# EasyEDA Pro project esp32s3clock.epro, schematic Schematic2

## Sheets
1 P1: Assembly Variant: Basic; Board Name: Board2; Create Date: 2026-11-11; Page Name: P1; Project Name: ESPRESSIF32-S3_CLOCK_BAT; Schematic Name: Schematic2; Update Date: 2026-11-11; Company: https://www.lovesp32.com; Page Size: A4; Version: v4.0
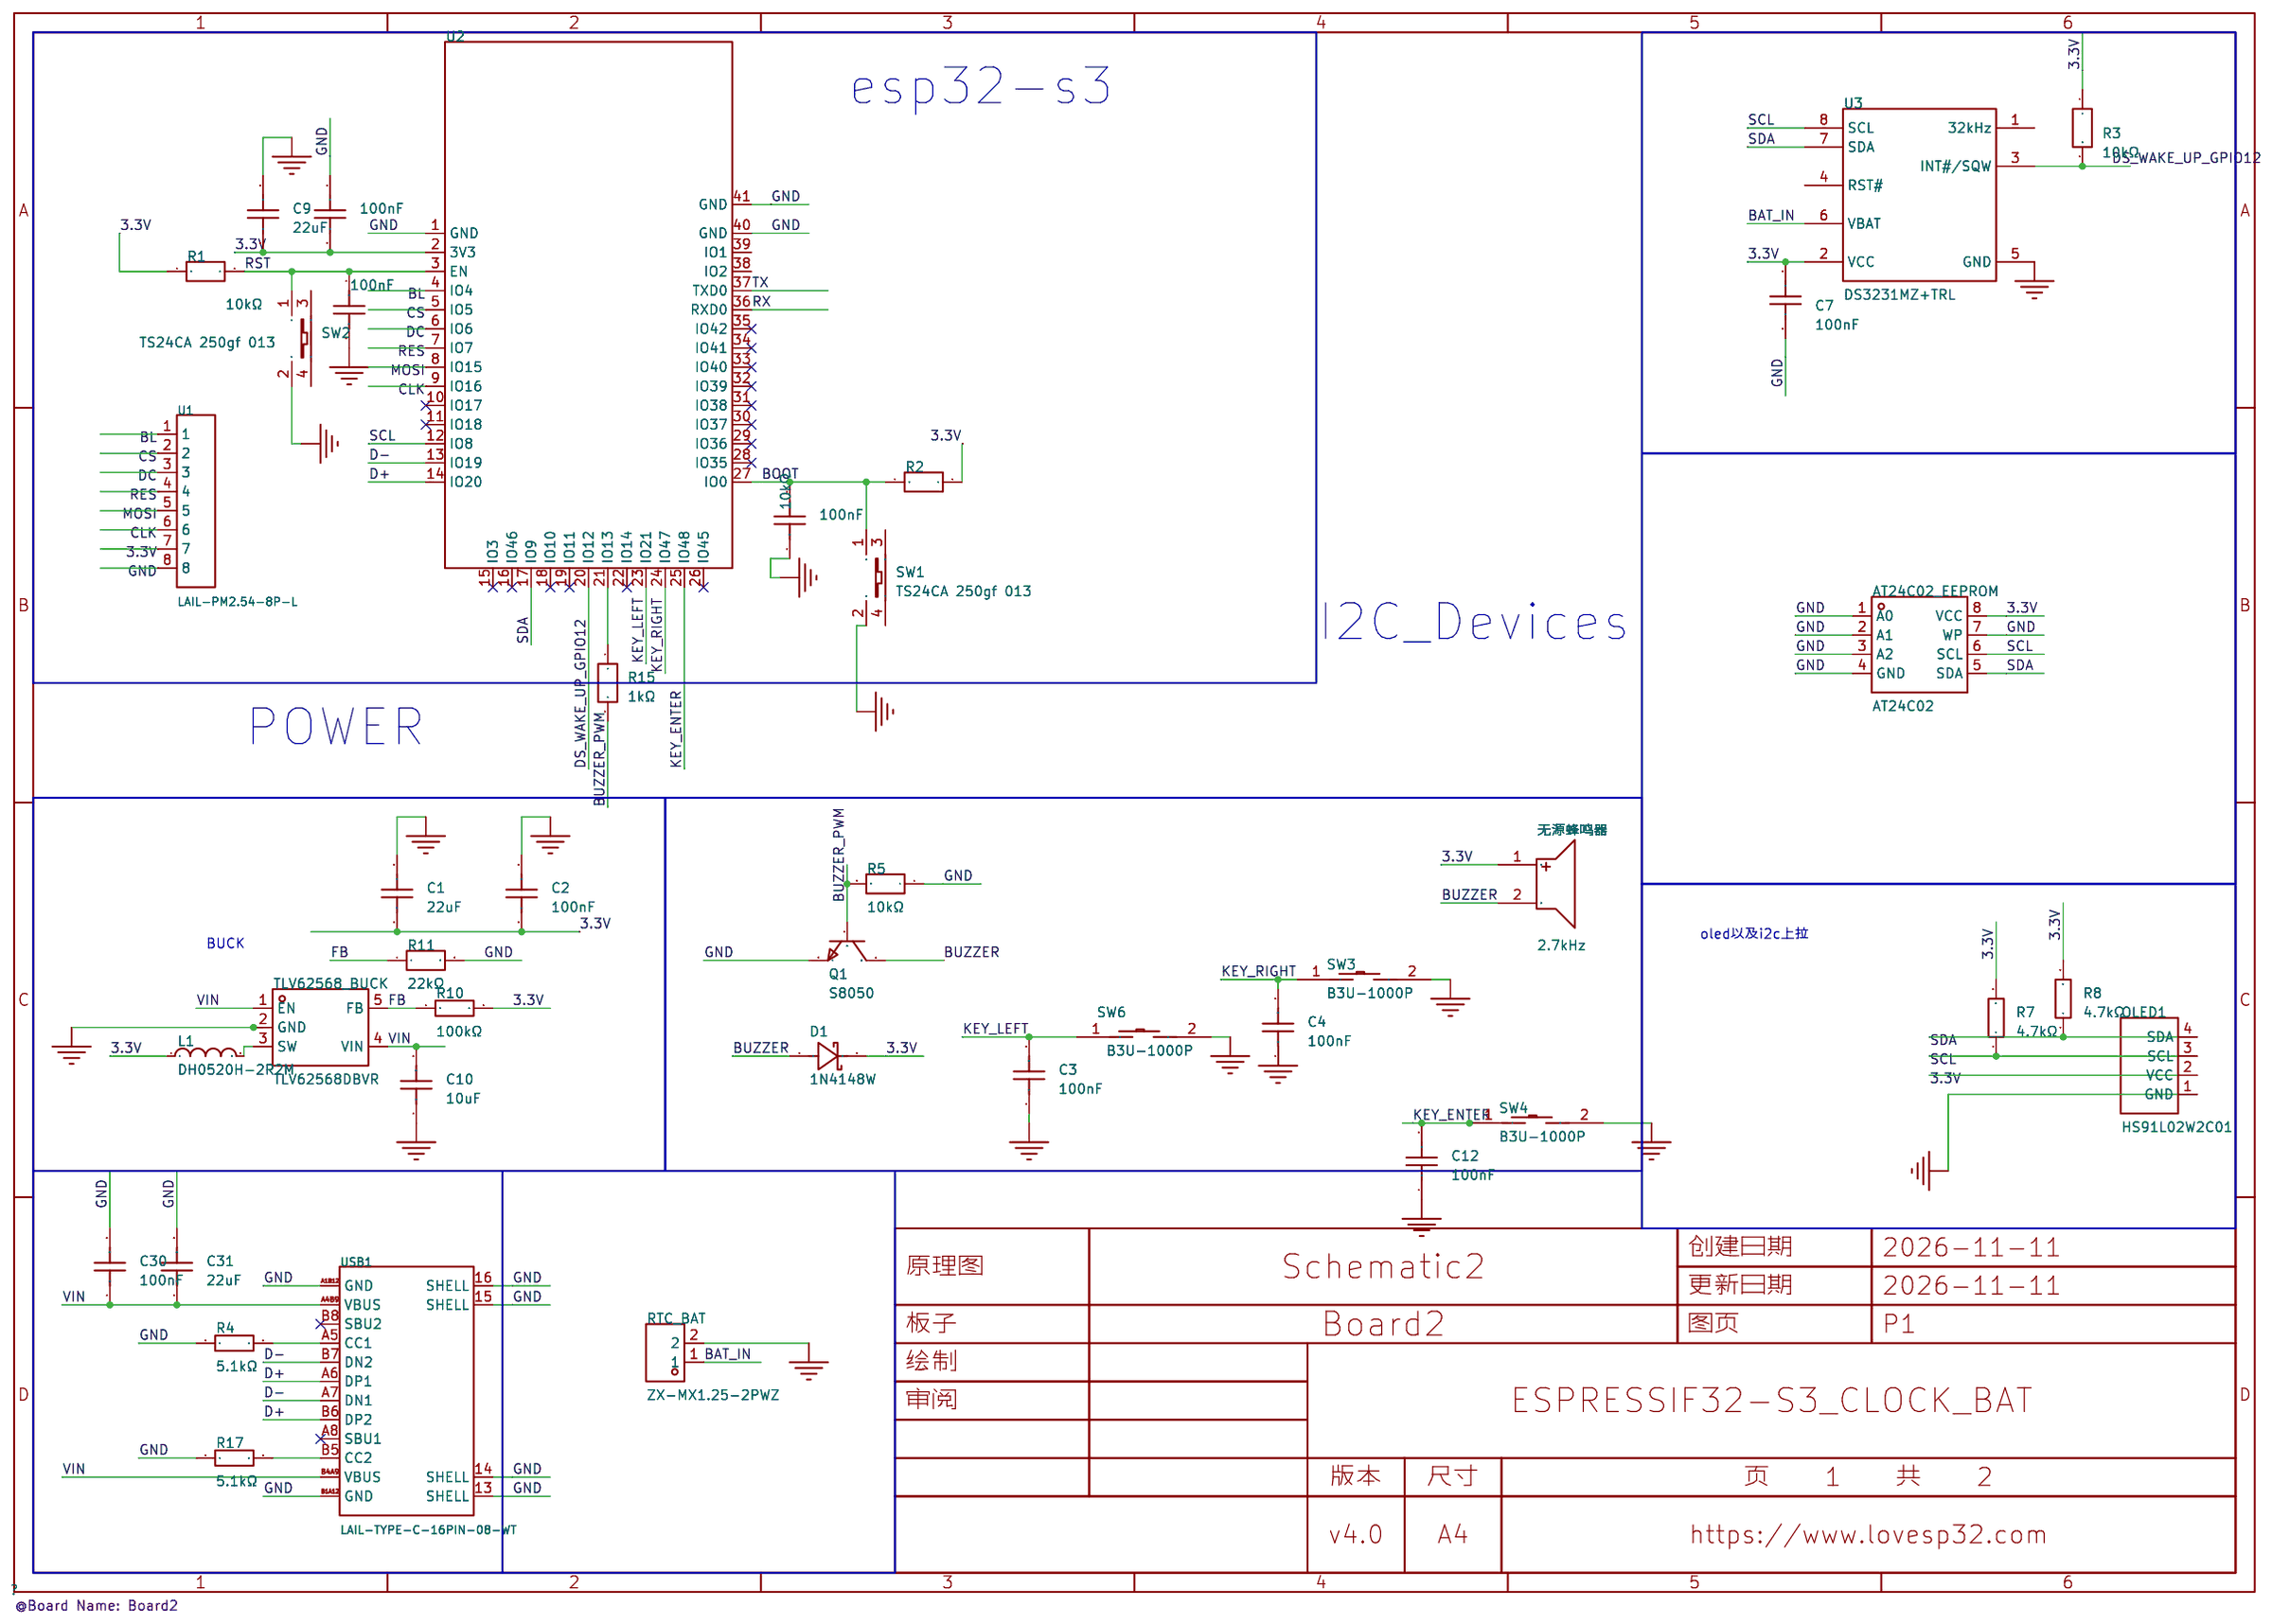
[diagram p2: P1]
2 bat: Page Name: bat; Company: 嘉立创EDA
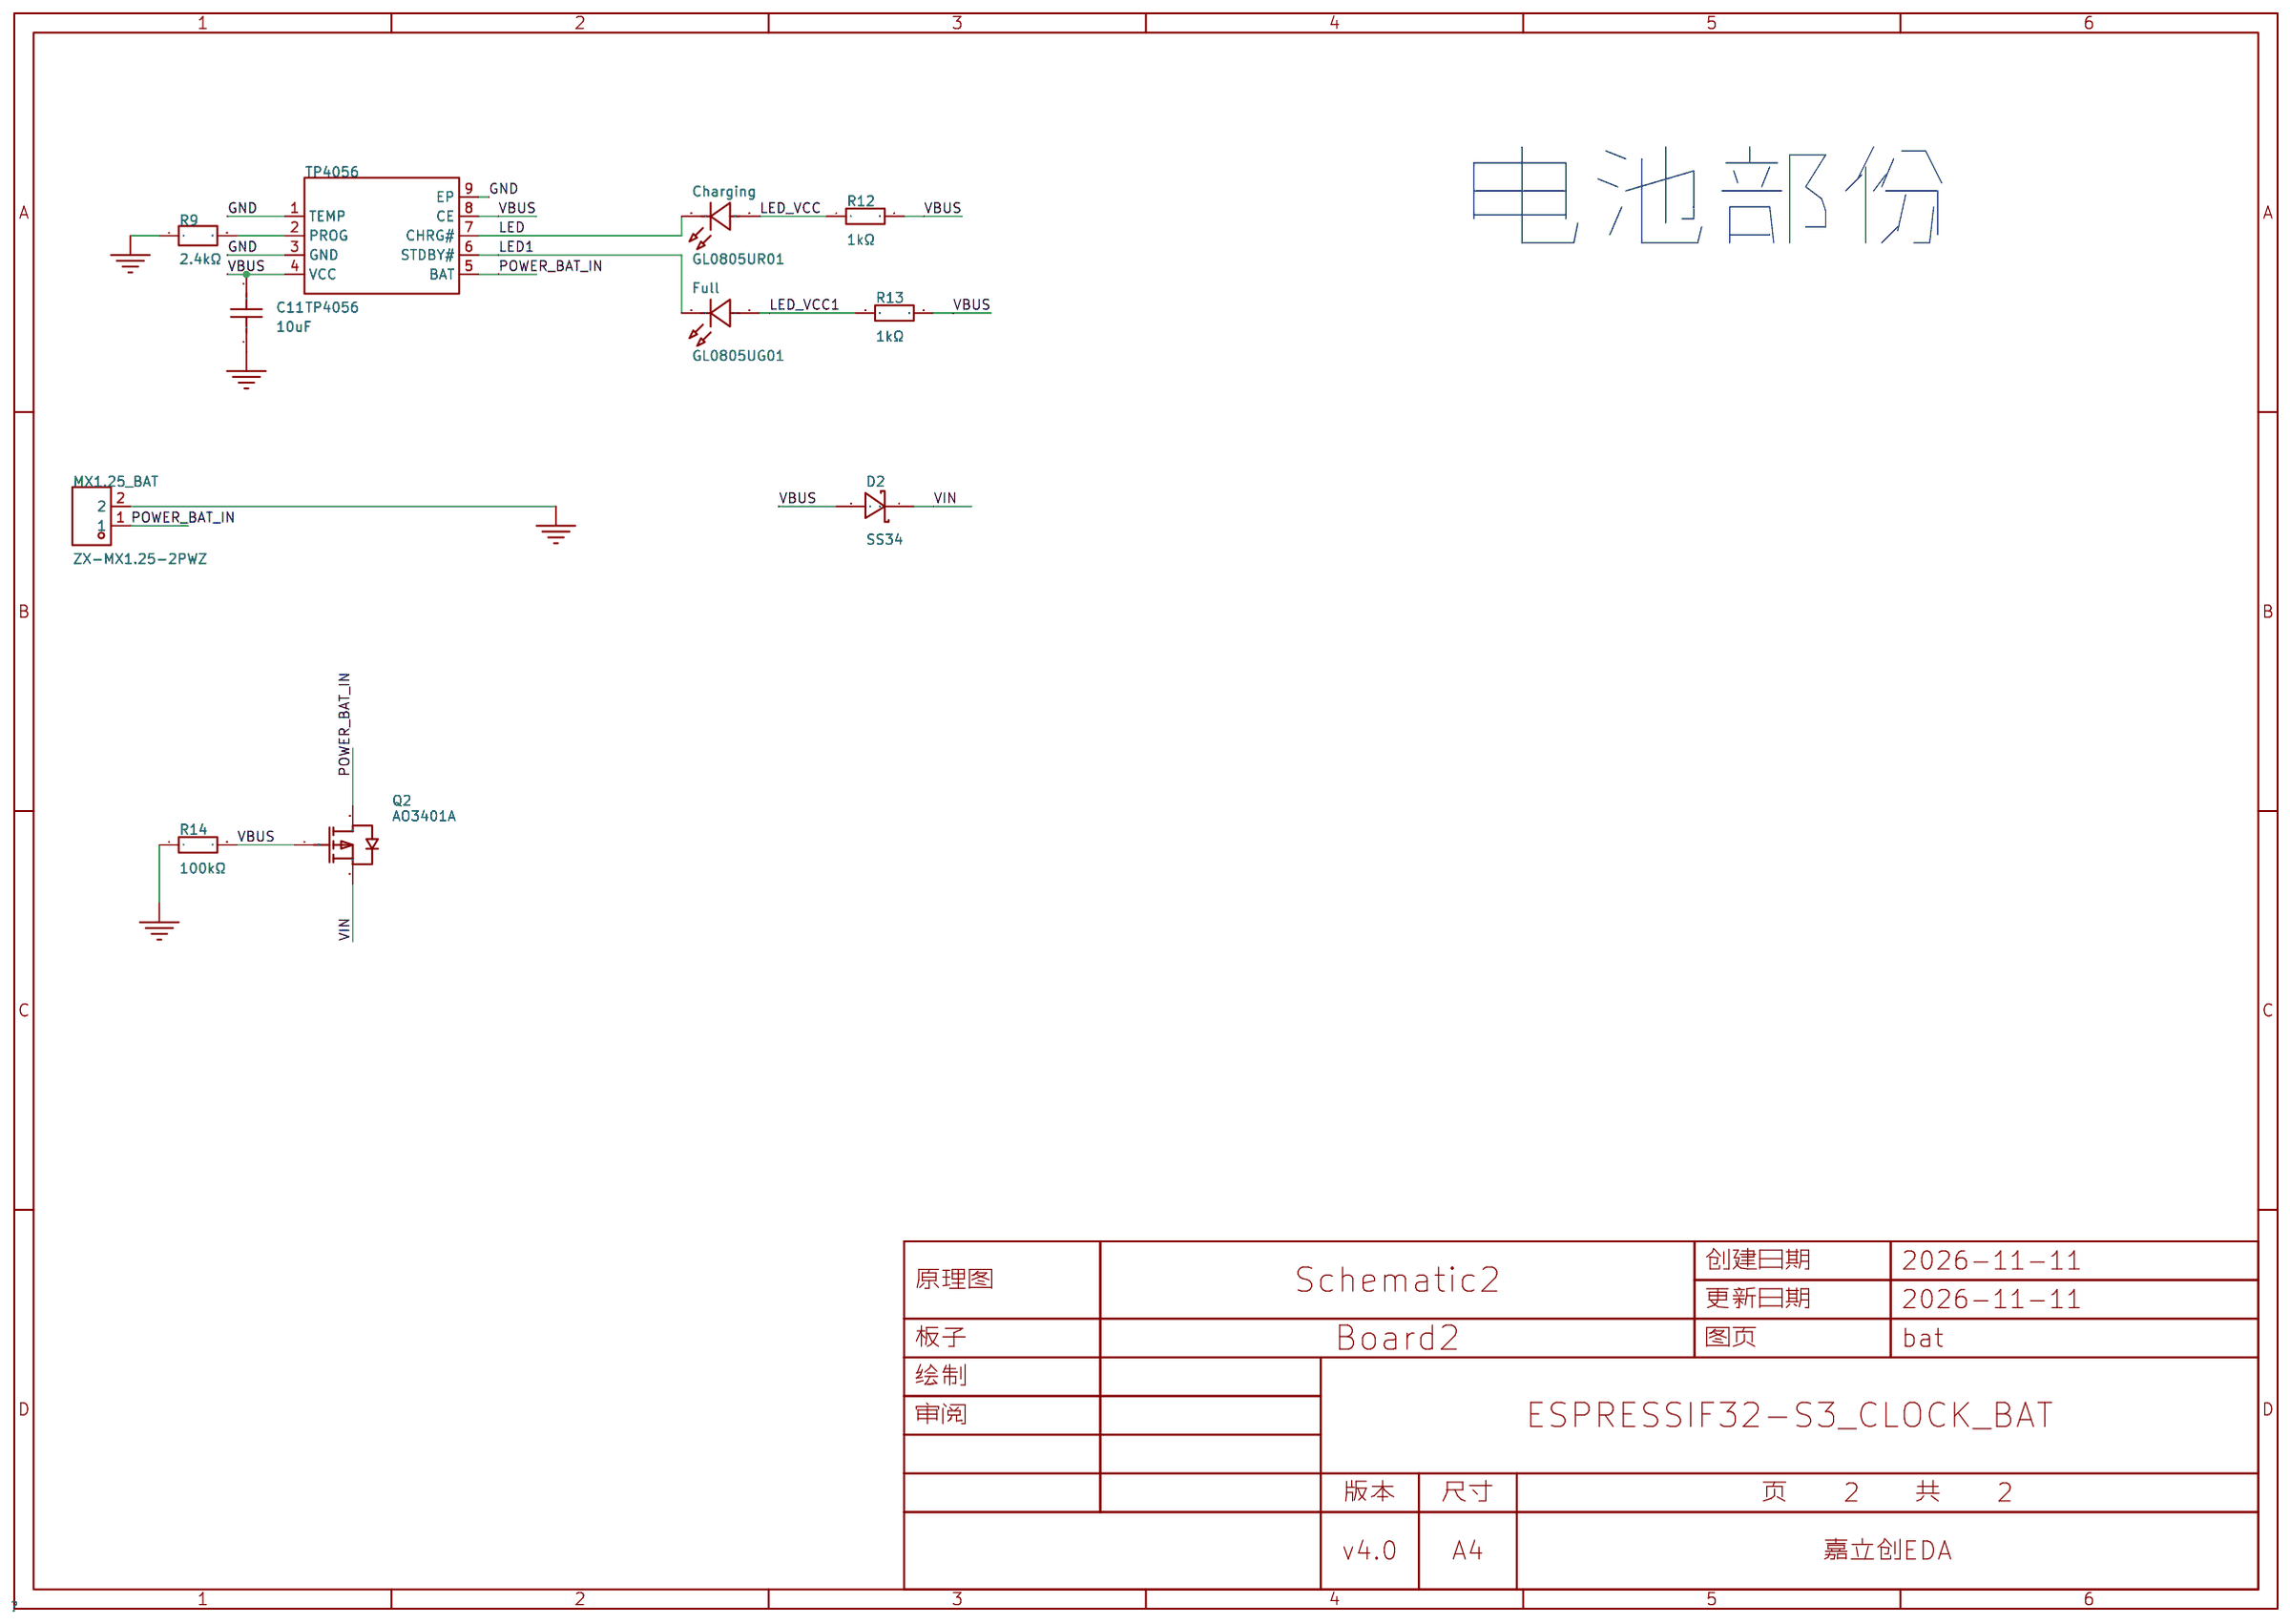
[diagram p3: bat]

## Parts
sheet bat
C11  10uF  [C0805]
Charging  GL0805UR01  [LED0805-R-RD_RED]
D2  SS34  [SMC_L6.9-W5.9-LS7.9-RD]
Full  GL0805UG01  [LED0805-FD_GL0805UG01]
MX1.25_BAT  ZX-MX1.25-2PWZ  [CONN-TH_2P-P1.25_ZX-MX1.25-2PWZ]
Q2  AO3401A  [SOT-23_L2.9-W1.3-P1.90-LS2.4-BR]
R9  2.4kΩ  [R0603]
R12  1kΩ  [R0805]
R13  1kΩ  [R0805]
R14  100kΩ  [R0805]
TP4056  TP4056  [ESOP-8_L4.9-W3.9-P1.27-LS6.0-BL-EP]
sheet P1
AT24C02_EEPROM  AT24C02  [SOP-8_L5.0-W4.0-P1.27-LS6.0-BL]
C1  22uF  [C1210]
C2  100nF  [C0805]
C3  100nF  [C0805]
C4  100nF  [C0805]
C5  100nF  [C0805]
C6  100nF  [C0805]
C7  100nF  [C0805]
C8  100nF  [C0805]
C9  22uF  [C1210]
C10  10uF  [C0805]
C12  100nF  [C0805]
C30  100nF  [C0805]
C31  22uF  [C1206]
D1  1N4148W  [SOD-123_L2.7-W1.6-LS3.7-FD]
L1  DH0520H-2R2M  [IND-SMD_L5.6-W5.2_MST0530H-150M]
OLED1  HS91L02W2C01  [OLED-TH_L38.0-W12.0_HS91L02W2C01]
Q1  S8050  [SOT-23-3_L2.9-W1.3-P1.90-LS2.3-BR]
R1  10kΩ  [R0603]
R2  10kΩ  [R0603]
R3  10kΩ  [R0603]
R4  5.1kΩ  [R0603]
R5  10kΩ  [R0603]
R7  4.7kΩ  [R0603]
R8  4.7kΩ  [R0603]
R10  100kΩ  [R0805]
R11  22kΩ  [R0805]
R15  1kΩ  [R0603]
R17  5.1kΩ  [R0603]
RTC_BAT  ZX-MX1.25-2PWZ  [CONN-TH_2P-P1.25_ZX-MX1.25-2PWZ]
SW1  TS24CA 250gf 013  [SW-SMD_L4.7-W3.5-P3.35-EH]
SW2  TS24CA 250gf 013  [SW-SMD_L4.7-W3.5-P3.35-EH]
SW3  B3U-1000P  [KEY-SMD_B3U-1000PM]
SW4  B3U-1000P  [KEY-SMD_B3U-1000PM]
SW6  B3U-1000P  [KEY-SMD_B3U-1000PM]
TLV62568_BUCK  TLV62568DBVR  [SOT-23-5_L3.0-W1.7-P0.95-LS2.8-BR]
U1  LAIL-PM2.54-8P-L  [HDR-TH_LAIL-PM2.54-8P-L]
U2  2.4GHz  [WIRELM-SMD_ESP32-S3-WROOM-1]
U3  DS3231MZ+TRL  [SOIC-8_L4.9-W3.9-P1.27-LS6.0-BL]
USB1  LAIL-TYPE-C-16PIN-08-WT  [TYPE-C-SMD_LAIL-TYPE-C-16PIN-08-WT]
无源蜂鸣器  2.7kHz  [BUZ-TH_BD9.0-P4.00-D0.6-FD]

## Library data of the parts
C10 C11 = CL21A106KAYNNNE_C15850: 容值:10uF;精度:±10%;额定电压:25V;温度系数:X5R;; LCSC Part Name: 10uF ±10% 25V; Supplier Part: C15850; Manufacturer: SAMSUNG(三星); Manufacturer Part: CL21A106KAYNNNE; Supplier Footprint: 0805; JLCPCB Part Class: Basic Part; Datasheet: https://item.szlcsc.com/datasheet/CL21A106KAYNNNE/16532.html; Supplier: LCSC; Tolerance: ±10%; Voltage Rating: 25V; Temperature Coefficient: X5R
Charging = GL0805UR01: 灯头类型:2mmx1.25mm方形灯头;发光颜色:红色;正向压降(Vf):1.8V~2.1V;功率:-;测试电流:20mA;波长:620nm~625nm;二极管配置:独立二极管;透镜颜色:无色透明透镜;色温:-;发光强度:80mcd~100mcd;发光角度:120°;载带方式:正贴;工作温度:-40℃~+85℃;; LCSC Part Name: 0805 红灯 高亮; Supplier Part: C51933307; Manufacturer: Guiguang light(桂光光电); Supplier Footprint: 0805; JLCPCB Part Class: Extended Part; Datasheet: https://item.szlcsc.com/datasheet/GL0805UR01/54646003.html; Supplier: LCSC; Lamp Holder Type: 2mmx1.25mm方形灯头; Illumination Color: 红色; Voltage - Forward(Vf): 1.8V~2.1V; Test Current: 20mA; Wavelength - Dominant: 620nm~625nm; Diode Configuration: 独立二极管; Lens Color: 无色透明透镜; Luminous Intensity: 80mcd~100mcd; Viewing Angle: 120°; Mounting Style: 正贴; Operating Temperature: -40℃~+85℃
D2 = SS34_C154551: 正向压降(Vf):500mV@3A;直流反向耐压(Vr):40V;整流电流:3A;; LCSC Part Name: 电压:40V 电流:3A; Supplier Part: C154551; Manufacturer: onsemi(安森美); Supplier Footprint: SMC(DO-214AB); JLCPCB Part Class: Extended Part; Datasheet: https://item.szlcsc.com/datasheet/SS34/165893.html; Supplier: LCSC; Voltage - Forward(Vf@If): 500mV@3A; Voltage - DC Reverse(Vr): 40V; Current - Rectified: 3A; Reverse Leakage Current (Ir): 500uA@40V; Operating Junction Temperature Range: -55℃~+150℃; Non-Repetitive Peak Forward Surge Current: 100A
Full = GL0805UG01: 灯头类型:2mmx1.25mm方形灯头;发光颜色:翠绿色;正向压降(Vf):2.5V~3V;功率:-;测试电流:5mA;波长:510nm~531nm;二极管配置:独立二极管;透镜颜色:无色透明透镜;色温:-;发光强度:144mcd~300mcd;发光角度:120°;载带方式:正贴;工作温度:-40℃~+85℃;; LCSC Part Name: 0805 翠绿 高亮; Supplier Part: C51933308; Manufacturer: Guiguang light(桂光光电); Supplier Footprint: 0805; JLCPCB Part Class: Extended Part; Datasheet: https://item.szlcsc.com/datasheet/GL0805UG01/54646004.html; Supplier: LCSC; Lamp Holder Type: 2mmx1.25mm方形灯头; Illumination Color: 翠绿色; Voltage - Forward(Vf): 2.5V~3V; Test Current: 5mA; Wavelength - Dominant: 510nm~531nm; Diode Configuration: 独立二极管; Lens Color: 无色透明透镜; Luminous Intensity: 144mcd~300mcd; Viewing Angle: 120°; Mounting Style: 正贴; Operating Temperature: -40℃~+85℃
MX1.25_BAT RTC_BAT = ZX-MX1.25-2PWZ: 插针结构:1x2P;间距:1.25mm;安装方式:弯插;参考系列:PicoBlade(MX 1.25);总PIN数:2P;排数:1;每排PIN数:2;行距:-;额定电流:1A;触头材质:黄铜;触头镀层:锡;工作温度:-25℃~+85℃;; LCSC Part Name: 1x2P 间距:1.25mm 弯插 系列:PicoBlade(MX 1.25); Supplier Part: C7430463; Manufacturer: Megastar(兆星); Supplier Footprint: 弯插,P=1.25mm; JLCPCB Part Class: Extended Part; Datasheet: https://item.szlcsc.com/datasheet/ZX-MX1.25-2PWZ/8430332.html; Supplier: LCSC; Pins Structure: 1x2P; Pitch: 1.25mm; Mounting Type: 弯插; Reference Series: PicoBlade(MX 1.25); Number of Pins: 2P; Number of Rows: 1; Number of PINs Per Row: 2; Current Rating: 1A; Contact Material: 黄铜; Contact Plating: 锡; Operating Temperature: -25℃~+85℃; Voltage Rating: 125V; Plastic Material: LCP; Flame Retardant Rating: UL94V-0; Color: 米色; Z-Height of the Board: 3.3mm; X-Length of Bottom Edge on Board (Spacing Line): 4.4mm; Y-Width of Bottom Edge on Board: 4.6mm
Q2 = AO3401A_C15127: 数量:1个P沟道;漏源电压(Vdss):30V;连续漏极电流(Id):4A;导通电阻(RDS(on)):47mΩ@10V；85mΩ@2.5V；60mΩ@4.5V;耗散功率(Pd):-;阈值电压(Vgs(th)):900mV;; LCSC Part Name: 1个P沟道 耐压:30V 电流:4A; Supplier Part: C15127; Manufacturer: AOS; Supplier Footprint: SOT-23; JLCPCB Part Class: Basic Part; Datasheet: https://item.szlcsc.com/datasheet/AO3401A/15801.html; Supplier: LCSC; Number: 1个P沟道; Drain to Source Voltage: 30V; Current - Continuous Drain(Id): 4A; RDS(on): 47mΩ@10V；85mΩ@2.5V；60mΩ@4.5V; Gate Threshold Voltage (Vgs(th)): 900mV; Gate Charge(Qg): 14nC@10V; Input Capacitance(Ciss): 645pF; Reverse Transfer Capacitance (Crss@Vds): 55pF; Output Capacitance(Coss): 80pF
R9 = FRC0603F2401TS: 电阻类型:厚膜电阻;阻值:2.4kΩ;精度:±1%;功率:100mW;工作电压:75V;温度系数:±100ppm/℃;; LCSC Part Name: 2.4kΩ ±1% 100mW 厚膜电阻; Supplier Part: C2907007; Manufacturer: FOJAN(富捷); Supplier Footprint: 0603; JLCPCB Part Class: Extended Part; Supplier: LCSC; Type: 厚膜电阻; Tolerance: ±1%; Power(Watts): 100mW; Voltage-Supply(Max): 75V; Temperature Coefficient: ±100ppm/℃; Operating Temperature: -55℃~+155℃
R12 R13 = 0805W8F1001T5E: 电阻类型:厚膜电阻;阻值:1kΩ;精度:±1%;功率:125mW;最大工作电压:150V;温度系数:±100ppm/℃;; LCSC Part Name: 1kΩ ±1% 125mW 厚膜电阻; Supplier Part: C17513; Manufacturer: UNI-ROYAL(厚声); Supplier Footprint: 0805; JLCPCB Part Class: Basic Part; Datasheet: https://atta.szlcsc.com/upload/public/pdf/source/20200306/C422600_1E6D84923E4A46A82E41ADD87F860B5C.pdf; Supplier: LCSC; Type: 厚膜电阻; Tolerance: ±1%; Power(Watts): 125mW; Overload Voltage (Max): 150V; Temperature Coefficient: ±100ppm/℃; Operating Temperature Range: -55℃~+155℃
R10 R14 = 0805W8F1003T5E: 电阻类型:厚膜电阻;阻值:100kΩ;精度:±1%;功率:125mW;工作电压:150V;温度系数:±100ppm/℃;; LCSC Part Name: 100kΩ ±1% 125mW 厚膜电阻; Supplier Part: C149504; Manufacturer: UNI-ROYAL(厚声); Supplier Footprint: 0805; JLCPCB Part Class: Basic Part; Datasheet: https://item.szlcsc.com/datasheet/0805W8F1003T5E/160838.html; Supplier: LCSC; Type: 厚膜电阻; Tolerance: ±1%; Power(Watts): 125mW; Voltage-Supply(Max): 150V; Temperature Coefficient: ±100ppm/℃; Operating Temperature: -55℃~+155℃
TP4056 = TP4056_C725790: 工作电压:4V~6.5V;最大充电电流:1A;电池类型:锂电池;电池节数:1;; LCSC Part Name: 1A独立式线性锂离子电池充电器; Supplier Part: C725790; Manufacturer: UMW(友台半导体); Supplier Footprint: ESOP-8; JLCPCB Part Class: Extended Part; Datasheet: https://item.szlcsc.com/datasheet/TP4056/772193.html; Supplier: LCSC; The Chip Type: 充电芯片; Voltage - Supply: 4V~6.5V; Charge Current - Max: 1A; Charging Saturation Voltage: 4.2V; Type of Battery: 锂电池; Number of Cells: 1; Operating Temperature: -40℃~+85℃; Battery Temperature Detection: 支持; 0V Battery Charge: 支持; Supply Current (Iq): 35uA; Features: 恒压充电；恒流充电；自动再充电；充电终止；软启动；可编程充电电流；欠压锁定；涓流充电
AT24C02_EEPROM = AT24C02_C688857: 接口类型:I2C;存储容量:2Kbit;时钟频率(fc):1MHz;; LCSC Part Name: 24C02 2Kbit电可擦除PROM; Supplier Part: C688857; Manufacturer: IDCHIP(英锐芯); Supplier Footprint: SOP-8; JLCPCB Part Class: Extended Part; Datasheet: https://item.szlcsc.com/datasheet/AT24C02/721923.html; Supplier: LCSC; Interface: I2C; Memory Size: 2Kbit; Clock Frequency: 1MHz; Write Cycle Time(Tw): 5ms; Data Retention - TDR (Year): 100年; Write Cycle Endurance: 100万次; Features: 硬件写保护功能；噪声抑制功能; Voltage - Supply: 1.8V~5.5V; Operating Temperature: -40℃~+85℃; Operating Current: 1mA; Standby Current: 1uA; Access Time: 900ns
C1 C9 = CL32A226KAJNNNE: 容值:22uF;精度:±10%;额定电压:25V;温度系数:X5R;; LCSC Part Name: 22uF ±10% 25V; Supplier Part: C52306; Manufacturer: SAMSUNG(三星); Supplier Footprint: 1210; JLCPCB Part Class: Extended Part; Datasheet: https://item.szlcsc.com/datasheet/CL32A226KAJNNNE/53320.html; Supplier: LCSC; Tolerance: ±10%; Voltage Rating: 25V; Temperature Coefficient: X5R
C2-C4 C7 C12 = CL21B104KBCNNNC: 容值:100nF;精度:±10%;额定电压:50V;温度系数:X7R;; LCSC Part Name: 100nF ±10% 50V; Supplier Part: C1711; Manufacturer: SAMSUNG(三星); Supplier Footprint: 0805; JLCPCB Part Class: Extended Part; Datasheet: https://item.szlcsc.com/datasheet/CL21B104KBCNNNC/2063.html; Supplier: LCSC; Tolerance: ±10%; Voltage Rating: 50V; Temperature Coefficient: X7R
C5 C6 C8 = CC0805KRX7R9BB104: 容值:100nF;精度:±10%;额定电压:50V;温度系数:X7R;; LCSC Part Name: 100nF ±10% 50V; Supplier Part: C49678; Manufacturer: YAGEO(国巨); Supplier Footprint: 0805; JLCPCB Part Class: Basic Part; Datasheet: https://item.szlcsc.com/datasheet/CC0805KRX7R9BB104/50686.html; Supplier: LCSC; Tolerance: ±10%; Voltage Rating: 50V; Temperature Coefficient: X7R
C30 = FCC0805B104K500DT: 容值:100nF;精度:±10%;额定电压:50V;温度系数:X7R;; LCSC Part Name: 100nF ±10% 50V; Supplier Part: C5137467; Manufacturer: FOJAN(富捷); Supplier Footprint: 0805; JLCPCB Part Class: Extended Part; Datasheet: https://item.szlcsc.com/datasheet/FCC0805B104K500DT/5746969.html; Supplier: LCSC; Tolerance: ±10%; Voltage Rating: 50V; Temperature Coefficient: X7R; Operating Temperature: -55℃~+125℃
C31 = HGC1206R5226M250NSPJ: 容值:22uF;精度:±20%;额定电压:25V;温度系数:X5R;; LCSC Part Name: 22uF ±20% 25V; Supplier Part: C7432786; Manufacturer: Chinocera(华瓷); Supplier Footprint: 1206; JLCPCB Part Class: Extended Part; Datasheet: https://item.szlcsc.com/datasheet/HGC1206R5226M250NSPJ/8438268.html; Supplier: LCSC; Tolerance: ±20%; Voltage Rating: 25V; Temperature Coefficient: X5R
D1 = 1N4148W_C7420318: 二极管配置:独立式;整流电流:150mA;直流反向耐压(Vr):100V;正向压降(Vf):1.25V@150mA;反向恢复时间(Trr):4ns;; LCSC Part Name: 100V 150mA; Supplier Part: C7420318; Manufacturer: R+O(宏嘉诚); Supplier Footprint: SOD-123; JLCPCB Part Class: Extended Part; Datasheet: https://item.szlcsc.com/datasheet/1N4148W/8397140.html; Supplier: LCSC; Diode Configuration: 独立式; Pd - Power Dissipation: 400mW; Current - Rectified: 150mA; Voltage - DC Reverse(Vr): 100V; Voltage - Forward(Vf@If): 1.25V@150mA; Non-Repetitive Peak Forward Surge Current: 2A; Reverse Leakage Current (Ir): 1uA@75V; Reverse Recovery Time (trr): 4ns; Operating Junction Temperature Range: -55℃~+150℃
L1 = DH0520H-2R2M: 一体成型电感，功率电感，合金电感，贴片电感.公司通过ISO90001:2015和IATF16949:2016体系认证，产品主要应用于：汽车电子(车灯、车机屏、BMS、自动驾驶控制模块等)、电脑主板(台式、笔记本、平板)、显卡、交换机、路由器、电视机、显示器、音箱、手机、通讯基站、各种机器设备控制板等。; LCSC Part Name: DH0520H-2R2M（2.2uH); Supplier Part: C41407019; Manufacturer: DH(德鸿感应); Supplier Footprint: SMD,5.6x5.2mm; Datasheet: https://item.szlcsc.com/datasheet/DH0520H-2R2M/43206035.html; Supplier: LCSC
OLED1 = HS91L02W2C01: 主控芯片:SSD1306芯片;接口类型:I2C;尺寸(inch):0.91;像素分辨率:128x32;; LCSC Part Name: 0.91寸OLED显示屏白光IIC; Supplier Part: C5248081; Manufacturer: HS(汉昇); JLCPCB Part Class: Extended Part; Datasheet: https://item.szlcsc.com/datasheet/HS91L02W2C01/5960632.html; Supplier: LCSC; Controller Type: SSD1306芯片; Interface: I2C; Size: 0.91; Dot Pixels: 128x32; Type of Drive: 无源(PMOLED); Display Range: 22.384x5.584mm; Display Color: 白色; Luminance: 150cd/m2; Voltage - Supply  For Logic: 1.65V~3.3V
Q1 = S8050_C20069125: 晶体管类型:NPN;集电极电流(Ic):500mA;集射极击穿电压(Vceo):25V;耗散功率(Pd):300mW;直流电流增益(hFE):120;; LCSC Part Name: hFE:200-350，丝印:J3Y NPN 500mA 25V; Supplier Part: C20069125; Manufacturer: R+O(宏嘉诚); Supplier Footprint: SOT-23; JLCPCB Part Class: Extended Part; Datasheet: https://item.szlcsc.com/datasheet/S8050/21397163.html; Supplier: LCSC; type: NPN; Current - Collector(Ic): 500mA; Collector - Emitter Voltage VCEO: 25V; Pd - Power Dissipation: 300mW; DC Current Gain: 120; Transition frequency(fT): 100MHz; Current - Collector Cutoff: 100nA; Vce Saturation(VCE(sat)): 600mV; Operating Temperature: -55℃~+150℃; Emitter-Base Voltage(Vebo): 5V; Number: 1个NPN; Configuration: 独立式
R1-R3 R5 = FRC0603F1002TS: 电阻类型:厚膜电阻;阻值:10kΩ;精度:±1%;功率:100mW;工作电压:75V;温度系数:±100ppm/℃;; LCSC Part Name: 10kΩ ±1% 100mW 厚膜电阻; Supplier Part: C2906982; Manufacturer: FOJAN(富捷); Supplier Footprint: 0603; JLCPCB Part Class: Extended Part; Datasheet: https://item.szlcsc.com/datasheet/FRC0603F1002TS/3180495.html; Supplier: LCSC; Type: 厚膜电阻; Tolerance: ±1%; Power(Watts): 100mW; Voltage-Supply(Max): 75V; Temperature Coefficient: ±100ppm/℃; Operating Temperature: -55℃~+155℃
R4 R17 = 0603WAF5101T5E: 电阻类型:厚膜电阻;阻值:5.1kΩ;精度:±1%;功率:100mW;工作电压:75V;温度系数:±100ppm/℃;; LCSC Part Name: 厚膜电阻 5.1kΩ ±1%; Supplier Part: C23186; Manufacturer: UNI-ROYAL(厚声); Supplier Footprint: 0603; JLCPCB Part Class: Basic Part; Datasheet: https://item.szlcsc.com/datasheet/0603WAF5101T5E/23913.html; Supplier: LCSC; Type: 厚膜电阻; Tolerance: ±1%; Power(Watts): 100mW; Voltage-Supply(Max): 75V; Temperature Coefficient: ±100ppm/℃; Operating Temperature: -55℃~+155℃
R7 R8 = 0603WAF4701T5E: 电阻类型:厚膜电阻;阻值:4.7kΩ;精度:±1%;功率:100mW;工作电压:75V;温度系数:±100ppm/℃;; LCSC Part Name: 厚膜电阻 4.7kΩ ±1%; Supplier Part: C23162; Manufacturer: UNI-ROYAL(厚声); Supplier Footprint: 0603; JLCPCB Part Class: Basic Part; Datasheet: https://item.szlcsc.com/datasheet/0603WAF4701T5E/23889.html; Supplier: LCSC; Type: 厚膜电阻; Tolerance: ±1%; Power(Watts): 100mW; Voltage-Supply(Max): 75V; Temperature Coefficient: ±100ppm/℃; Operating Temperature: -55℃~+155℃
R11 = FRC0805F2202TS: 电阻类型:厚膜电阻;阻值:22kΩ;精度:±1%;功率:125mW;工作电压:150V;温度系数:±100ppm/℃;; LCSC Part Name: 22kΩ ±1% 125mW 厚膜电阻; Supplier Part: C2907243; Manufacturer: FOJAN(富捷); Supplier Footprint: 0805; JLCPCB Part Class: Extended Part; Datasheet: https://item.szlcsc.com/datasheet/FRC0805F2202TS/3180756.html; Supplier: LCSC; Type: 厚膜电阻; Tolerance: ±1%; Power(Watts): 125mW; Voltage-Supply(Max): 150V; Temperature Coefficient: ±100ppm/℃; Operating Temperature: -55℃~+155℃
R15 = FRC0603F1001TS: 电阻类型:厚膜电阻;阻值:1kΩ;精度:±1%;功率:100mW;工作电压:75V;温度系数:±100ppm/℃;; LCSC Part Name: 1kΩ ±1% 100mW 厚膜电阻; Supplier Part: C2907002; Manufacturer: FOJAN(富捷); Supplier Footprint: 0603; JLCPCB Part Class: Extended Part; Datasheet: https://item.szlcsc.com/datasheet/FRC0603F1001TS/3180515.html; Supplier: LCSC; Type: 厚膜电阻; Tolerance: ±1%; Power(Watts): 100mW; Voltage-Supply(Max): 75V; Temperature Coefficient: ±100ppm/℃; Operating Temperature: -55℃~+155℃
SW1 SW2 = TS24CA 250gf 013: 电路结构:单刀单掷;按钮形状:矩形按钮;作用力:2.5N;安装方式:卧贴;开关长度:4.7mm;开关宽度:1.9mm;开关高度:3.5mm;带支架:不带支架;触点电流:50mA;额定电压:12V;带灯:无;工作寿命:3万次;; LCSC Part Name: 4.55*1.8*3.5mm 卧贴 轻触开关; Supplier Part: C5373430; Manufacturer: SHOU HAN(首韩); Supplier Footprint: SMD; JLCPCB Part Class: Extended Part; Datasheet: https://item.szlcsc.com/datasheet/TS24CA%2520250gf%2520013/6227347.html; Supplier: LCSC; Circuit: 单刀单掷; Actuator Style: 矩形按钮; Operating Force: 2.5N; Mounting Type: 卧贴; Length: 4.7mm; Width: 1.9mm; Switch Height: 3.5mm; with Bracket: 不带支架; Contact Current: 50mA; Voltage Rating: 12V; Actuator/Cap Color: 黑色; With Lamp: 无; Termination Style: SMD接片; Life: 3万次; Operating Temperature: -25℃~+70℃
SW3 SW4 SW6 = B3U-1000P: 电路结构:单刀单掷;按钮形状:圆形按钮;作用力:1.53N;安装方式:立贴;开关长度:3mm;开关宽度:2.5mm;开关高度:1.6mm;触点电流:50mA;额定电压:12V;带灯:-;工作寿命:-;; LCSC Part Name: 3*2.5*1.6mm 立贴 轻触开关; Supplier Part: C231329; Manufacturer: OMRON(欧姆龙); Supplier Footprint: SMD,2.5x3mm; JLCPCB Part Class: Extended Part; Datasheet: https://item.szlcsc.com/datasheet/B3U-1000P/231216.html; Supplier: LCSC; Circuit: 单刀单掷; Actuator Style: 圆形按钮; Operating Force: 1.53N; Mounting Type: 立贴; Length: 3mm; Width: 2.5mm; Switch Height: 1.6mm; Contact Current: 50mA; Voltage Rating: 12V; Termination Style: SMD接片; Operating Temperature: -25℃~+70℃
TLV62568_BUCK = TLV62568DBVR: 功能类型:降压型;工作电压:2.5V~5.5V;输出电压:600mV~5.5V;输出电流:1A;输出类型:可调;; LCSC Part Name: 降压型 1A 2.5V~5.5V; Supplier Part: C163219; Manufacturer: TI(德州仪器); Supplier Footprint: SOT-23-5; JLCPCB Part Class: Extended Part; Datasheet: https://www.ti.com/cn/lit/ds/symlink/tlv62568.pdf; Supplier: LCSC; Function: 降压型; Voltage - Supply: 2.5V~5.5V; Output Voltage: 600mV~5.5V; Output Current: 1A; Frequency - Switching: 1.5MHz; Operating Temperature: -40℃~+125℃@(TJ); Synchronous Rectifier: 是; Number of Outputs: 1; Topology: 降压式; Quiescent Current: 35uA; Switch tube (built-in/external): 内置; Output Type: 可调; Features: 轻载高效模式；过流保护；工作状态指示
U1 = LAIL-PM2.54-8P-L: 插孔结构:1x8P;间距:2.54mm;圆孔/方孔:方孔;安装方式:直插;排数:单排;总孔位数:8P;额定电流:3A;额定电压:250V;插孔方向:顶部;塑高:8.5mm;触头材质:黄铜;触头镀层:金;工作温度:-25℃~+80℃;; LCSC Part Name: 1x8P 间距:2.54mm 直插; Supplier Part: C54973824; Manufacturer: LAILAN(莱联); Supplier Footprint: 插件,P=2.54mm; JLCPCB Part Class: Extended Part; Datasheet: https://item.szlcsc.com/datasheet/LAIL-PM2.54-8P-L/58554902.html; Supplier: LCSC; Holes Structure: 1x8P; Pitch: 2.54mm; Circular Hole / Square Hole: 方孔; Mounting Type: 直插; Number of Rows: 单排; Number of Positions: 8P; Current Rating: 3A; Voltage Rating (Max): 250V; Holes Direction: 顶部; Insulation Height: 8.5mm; Contact Material: 黄铜; Contact Plating: 金; Operating Temperature: -25℃~+80℃; PIN Length: 3mm
U2 = ESP32-S3-WROOM-1-N16R8: 核心芯片:ESP32-S3R8;频率:2.4GHz;天线形式:板载PCB天线;发射功率:20.5dBm;接收灵敏度:-103.5dBm;; LCSC Part Name: 不带固件 通用型Wi-Fi+低功耗蓝牙MCU模组; Supplier Part: C2913202; Manufacturer: ESPRESSIF(乐鑫); Supplier Footprint: SMD,25.5x18mm; JLCPCB Part Class: Extended Part; Datasheet: https://item.szlcsc.com/datasheet/ESP32-S3-WROOM-1-N16R8/3198300.html; Supplier: LCSC; Utilized IC / Part: ESP32-S3R8; Interface Type: I2C；GPIO；UART；SPI；USB；I2S; Antenna Type: 板载PCB天线; Output Power: 20.5dBm; Voltage - Supply: 3V~3.6V; Receive  Current: 95mA; Send  Current: 355mA; Sensitivity: -103.5dBm; Operating Temperature: -40℃~+65℃
U3 = DS3231MZ+TRL: 接口类型:I2C;晶振类型:内置;闹钟输出:有;; LCSC Part Name: 高精度RTC集成MEMS谐振器; Supplier Part: C107410; Manufacturer: ADI(亚德诺)/MAXIM(美信); Supplier Footprint: SOIC-8; JLCPCB Part Class: Extended Part; Datasheet: https://item.szlcsc.com/datasheet/DS3231MZ%252BTRL/108629.html; Supplier: LCSC; Interface: I2C; crystal oscillator: 内置; Alarm Output: 有; Current - Supply: 200uA; Voltage - Supply: 2.3V~5.5V; Quiescent Current(Iq): 100nA; Operating Temperature: -40℃~+85℃; Features: 备份电源管理与电池充电；温度补偿；告警功能；周期性中断输出
USB1 = LAIL-TYPE-C-16PIN-08-WT: 连接器类型:Type-C;公母:母;安装方式:卧贴;触点数量:16P;端口数量:1;额定电流 - 电源:3A;工作温度:-30℃~+85℃;; LCSC Part Name: Type-C 母 卧贴; Supplier Part: C55591235; Manufacturer: LAILAN(莱联); Supplier Footprint: SMD; JLCPCB Part Class: Extended Part; Datasheet: https://item.szlcsc.com/datasheet/LAIL-TYPE-C-16PIN-08-WT/59664940.html; Supplier: LCSC; Connector Type: Type-C; Gender: 母; Mounting Type: 卧贴; Number of Contacts: 16P; Number of Ports: 1; Current Rating-Power: 3A; Voltage Rating: 30V; Connect-Disconnect Life: 1万次; Detection color: 黑色; Operating Temperature: -30℃~+85℃
无源蜂鸣器 = QMB-09B-03: 驱动方式:无源(外部驱动);构造类型:电磁式;额定电压:3V;频率:2.7kHz;声压(SPL):85dB;; LCSC Part Name: 无源蜂鸣器QMB-09B-03; Supplier Part: C96256; Manufacturer: 华能; Supplier Footprint: 插件,D=9mm; JLCPCB Part Class: Extended Part; Datasheet: https://item.szlcsc.com/datasheet/QMB-09B-03/97460.html; Supplier: LCSC; Driver Circuitry: 无源(外部驱动); Technology: 电磁式; Voltage Rating: 3V; Voltage - Supply: 2V~5V; Current Consumption: 50mA; Sound Pressure Level(SPL): 85dB; Diameter(φD): 9mm; Height: 5.7mm; Operating Temperature: -20℃~+70℃

## Nets
3.3V: AT24C02_EEPROM.8(VCC) C1.1 C2.1 C5.2 C7.1 C9.1 D1.2(K) L1.1 OLED1.2(VCC) R1.1 R2.1 R3.1 R7.2 R8.2 R10.2 U1.7 U2.2(3V3) U3.2(VCC) 无源蜂鸣器.1
GND: AT24C02_EEPROM.1(A0) AT24C02_EEPROM.2(A1) AT24C02_EEPROM.3(A2) AT24C02_EEPROM.4(GND) AT24C02_EEPROM.7(WP) C1.2 C2.2 C3.1 C4.1 C5.1 C6.2 C7.2 C8.2 C9.2 C10.1 C11.1 C12.1 C30.2 C31.2 MX1.25_BAT.2 OLED1.1(GND) Q1.2(E) R4.1 R5.1 R9.1 R11.2 R14.1 R17.1 RTC_BAT.2 SW1.2 SW2.2 SW3.2 SW4.2 SW6.2 TLV62568_BUCK.2(GND) TP4056.1(TEMP) TP4056.3(GND) TP4056.9(EP) U1.8 U2.1(GND) U2.40(GND) U2.41(GND) U3.5(GND) USB1.13(SHELL) USB1.14(SHELL) USB1.15(SHELL) USB1.16(SHELL) USB1.A1B12(GND) USB1.B1A12(GND)
VBUS: C11.2 D2.2(A) Q2.1(G) R12.2 R13.2 R14.2 TP4056.4(VCC) TP4056.8(CE)
VIN: C10.2 C30.1 C31.1 D2.1(C) Q2.2(S) TLV62568_BUCK.1(EN) TLV62568_BUCK.4(VIN) USB1.A4B9(VBUS) USB1.B4A9(VBUS)
BAT_IN: RTC_BAT.1 U3.6(VBAT)
BL: U1.1 U2.4(IO4)
BOOT: C6.1 R2.2 SW1.1 U2.27(IO0)
BUZZER: D1.1(A) Q1.3(C) 无源蜂鸣器.2
BUZZER_PWM: Q1.1(B) R5.2 R15.2
CLK: U1.6 U2.9(IO16)
CS: U1.2 U2.5(IO5)
D+: U2.14(IO20) USB1.A6(DP1) USB1.B6(DP2)
D-: U2.13(IO19) USB1.A7(DN1) USB1.B7(DN2)
DC: U1.3 U2.6(IO6)
DS_WAKE_UP_GPIO12: R3.2 U2.20(IO12) U3.3(INT#/SQW)
FB: R10.1 R11.1 TLV62568_BUCK.5(FB)
KEY_ENTER: C12.2 SW4.1 U2.25(IO48)
KEY_LEFT: C3.2 SW6.1 U2.23(IO21)
KEY_RIGHT: C4.2 SW3.1 U2.24(IO47)
LED: Charging.2(C) TP4056.7(CHRG#)
LED1: Full.2(C) TP4056.6(STDBY#)
LED_VCC: Charging.1(A) R12.1
LED_VCC1: Full.1(A) R13.1
MOSI: U1.5 U2.8(IO15)
POWER_BAT_IN: MX1.25_BAT.1 Q2.3(D) TP4056.5(BAT)
RES: U1.4 U2.7(IO7)
RST: C8.1 R1.2 SW2.1 U2.3(EN)
RX: U2.36(RXD0)
SCL: AT24C02_EEPROM.6(SCL) OLED1.3(SCL) R7.1 U2.12(IO8) U3.8(SCL)
SDA: AT24C02_EEPROM.5(SDA) OLED1.4(SDA) R8.1 U2.17(IO9) U3.7(SDA)
TX: U2.37(TXD0)
$1N30: R15.1 U2.21(IO13)
$1N47: L1.2 TLV62568_BUCK.3(SW)
$1N62: R17.2 USB1.B5(CC2)
$1N63: R4.2 USB1.A5(CC1)
$3N15: R9.2 TP4056.2(PROG)

Not connected (* = marked no-connect by the designer): SW1 3 4; SW2 3 4; U2 10(IO17)* 11(IO18)* 15(IO3)* 16(IO46)* 18(IO10)* 19(IO11)* 22(IO14)* 26(IO45)* 28(IO35)* 29(IO36)* 30(IO37)* 31(IO38)* 32(IO39)* 33(IO40)* 34(IO41)* 35(IO42)* 38(IO2) 39(IO1); U3 1(32kHz) 4(RST#); USB1 A8(SBU1)* B8(SBU2)*

## Notes on the sheets
sheet 1
- esp32-s3
- I2C_Devices
- POWER
- BUCK
- oled以及i2c上拉
sheet 2
- 电池部份
